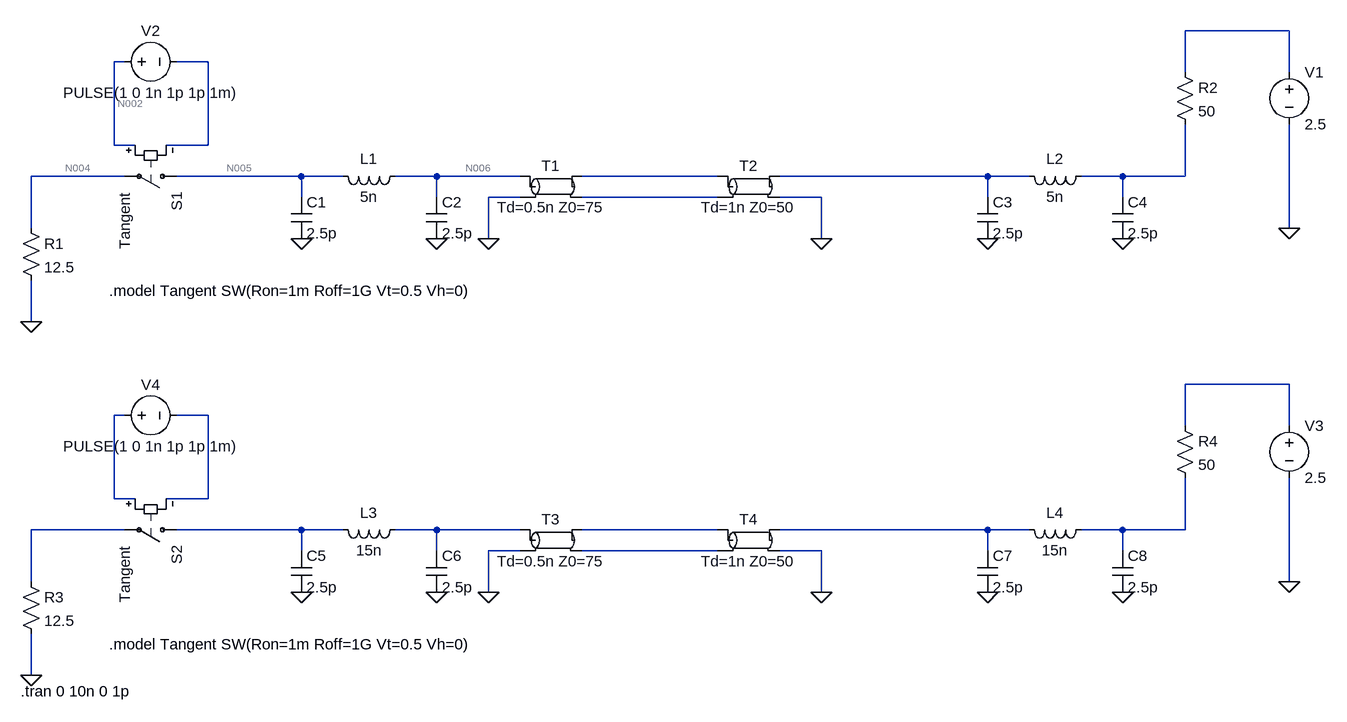
[diagram p0: schematic Exercise8_part4.asc]
Exercise8_part4.asc, the LTspice schematic file:
Version 4.1
SHEET 1 1648 1032
WIRE 1584 0 1424 0
WIRE -208 48 -224 48
WIRE -80 48 -128 48
WIRE 1424 64 1424 0
WIRE 1584 64 1584 0
WIRE -224 176 -224 48
WIRE -192 176 -224 176
WIRE -80 176 -80 48
WIRE -80 176 -144 176
WIRE -208 224 -352 224
WIRE 64 224 -128 224
WIRE 128 224 64 224
WIRE 272 224 208 224
WIRE 400 224 272 224
WIRE 704 224 496 224
WIRE 1120 224 800 224
WIRE 1184 224 1120 224
WIRE 1328 224 1264 224
WIRE 1424 224 1424 144
WIRE 1424 224 1328 224
WIRE 64 256 64 224
WIRE 272 256 272 224
WIRE 400 256 352 256
WIRE 704 256 496 256
WIRE 864 256 800 256
WIRE 1120 256 1120 224
WIRE 1328 256 1328 224
WIRE -352 304 -352 224
WIRE 1584 304 1584 144
WIRE 352 320 352 256
WIRE 864 320 864 256
WIRE -352 448 -352 384
WIRE 1584 544 1424 544
WIRE -208 592 -224 592
WIRE -80 592 -128 592
WIRE 1424 608 1424 544
WIRE 1584 608 1584 544
WIRE -224 720 -224 592
WIRE -192 720 -224 720
WIRE -80 720 -80 592
WIRE -80 720 -144 720
WIRE -208 768 -352 768
WIRE 64 768 -128 768
WIRE 128 768 64 768
WIRE 272 768 208 768
WIRE 400 768 272 768
WIRE 704 768 496 768
WIRE 1120 768 800 768
WIRE 1184 768 1120 768
WIRE 1328 768 1264 768
WIRE 1424 768 1424 688
WIRE 1424 768 1328 768
WIRE 64 800 64 768
WIRE 272 800 272 768
WIRE 400 800 352 800
WIRE 704 800 496 800
WIRE 864 800 800 800
WIRE 1120 800 1120 768
WIRE 1328 800 1328 768
WIRE -352 848 -352 768
WIRE 1584 848 1584 688
WIRE 352 864 352 800
WIRE 864 864 864 800
WIRE -352 992 -352 928
FLAG -352 448 0
FLAG 352 320 0
FLAG 864 320 0
FLAG 1584 304 0
FLAG 272 320 0
FLAG 64 320 0
FLAG 1328 320 0
FLAG 1120 320 0
FLAG -352 992 0
FLAG 352 864 0
FLAG 864 864 0
FLAG 1584 848 0
FLAG 272 864 0
FLAG 64 864 0
FLAG 1328 864 0
FLAG 1120 864 0
SYMBOL res -368 288 R0
SYMATTR InstName R1
SYMATTR Value 12.5
SYMBOL sw -112 224 R90
SYMATTR InstName S1
SYMATTR Value Tangent
SYMBOL tline 448 240 R0
SYMATTR InstName T1
SYMATTR Value Td=0.5n Z0=75
SYMBOL tline 752 240 R0
SYMATTR InstName T2
SYMATTR Value Td=1n Z0=50
SYMBOL res 1408 48 R0
SYMATTR InstName R2
SYMATTR Value 50
SYMBOL voltage 1584 48 R0
WINDOW 123 0 0 Left 0
WINDOW 39 0 0 Left 0
SYMATTR InstName V1
SYMATTR Value 2.5
SYMBOL voltage -224 48 R270
WINDOW 0 32 56 VTop 2
WINDOW 3 -32 56 VBottom 2
WINDOW 123 0 0 Left 0
WINDOW 39 0 0 Left 0
SYMATTR InstName V2
SYMATTR Value PULSE(1 0 1n 1p 1p 1m)
SYMBOL cap 48 256 R0
SYMATTR InstName C1
SYMATTR Value 2.5p
SYMBOL cap 256 256 R0
SYMATTR InstName C2
SYMATTR Value 2.5p
SYMBOL ind 224 208 R90
WINDOW 0 5 56 VBottom 2
WINDOW 3 32 56 VTop 2
SYMATTR InstName L1
SYMATTR Value 5n
SYMATTR SpiceLine Rser=1m
SYMBOL cap 1104 256 R0
SYMATTR InstName C3
SYMATTR Value 2.5p
SYMBOL cap 1312 256 R0
SYMATTR InstName C4
SYMATTR Value 2.5p
SYMBOL ind 1280 208 R90
WINDOW 0 5 56 VBottom 2
WINDOW 3 32 56 VTop 2
SYMATTR InstName L2
SYMATTR Value 5n
SYMATTR SpiceLine Rser=1m
SYMBOL res -368 832 R0
SYMATTR InstName R3
SYMATTR Value 12.5
SYMBOL sw -112 768 R90
SYMATTR InstName S2
SYMATTR Value Tangent
SYMBOL tline 448 784 R0
SYMATTR InstName T3
SYMATTR Value Td=0.5n Z0=75
SYMBOL tline 752 784 R0
SYMATTR InstName T4
SYMATTR Value Td=1n Z0=50
SYMBOL res 1408 592 R0
SYMATTR InstName R4
SYMATTR Value 50
SYMBOL voltage 1584 592 R0
WINDOW 123 0 0 Left 0
WINDOW 39 0 0 Left 0
SYMATTR InstName V3
SYMATTR Value 2.5
SYMBOL voltage -224 592 R270
WINDOW 0 32 56 VTop 2
WINDOW 3 -32 56 VBottom 2
WINDOW 123 0 0 Left 0
WINDOW 39 0 0 Left 0
SYMATTR InstName V4
SYMATTR Value PULSE(1 0 1n 1p 1p 1m)
SYMBOL cap 48 800 R0
SYMATTR InstName C5
SYMATTR Value 2.5p
SYMBOL cap 256 800 R0
SYMATTR InstName C6
SYMATTR Value 2.5p
SYMBOL ind 224 752 R90
WINDOW 0 5 56 VBottom 2
WINDOW 3 32 56 VTop 2
SYMATTR InstName L3
SYMATTR Value 15n
SYMATTR SpiceLine Rser=1m
SYMBOL cap 1104 800 R0
SYMATTR InstName C7
SYMATTR Value 2.5p
SYMBOL cap 1312 800 R0
SYMATTR InstName C8
SYMATTR Value 2.5p
SYMBOL ind 1280 752 R90
WINDOW 0 5 56 VBottom 2
WINDOW 3 32 56 VTop 2
SYMATTR InstName L4
SYMATTR Value 15n
SYMATTR SpiceLine Rser=1m
TEXT -232 400 Left 2 !.model Tangent SW(Ron=1m Roff=1G Vt=0.5 Vh=0)
TEXT -232 944 Left 2 !.model Tangent SW(Ron=1m Roff=1G Vt=0.5 Vh=0)
TEXT -368 1016 Left 2 !.tran 0 10n 0 1p

The netlist it stands for:
* Exercise8_part4.asc
R1 N004 0 12.5
S1 N005 N004 N002 N003 Tangent
T1 N006 0 N007 N010 Td=0.5n Z0=75
T2 N007 N010 N008 0 Td=1n Z0=50
R2 N001 N009 50
V1 N001 0 2.5
V2 N002 N003 PULSE(1 0 1n 1p 1p 1m)
C1 N005 0 2.5p
C2 N006 0 2.5p
L1 N006 N005 5n Rser=1m
C3 N008 0 2.5p
C4 N009 0 2.5p
L2 N009 N008 5n Rser=1m
R3 N014 0 12.5
S2 N015 N014 N012 N013 Tangent
T3 N016 0 N017 N020 Td=0.5n Z0=75
T4 N017 N020 N018 0 Td=1n Z0=50
R4 N011 N019 50
V3 N011 0 2.5
V4 N012 N013 PULSE(1 0 1n 1p 1p 1m)
C5 N015 0 2.5p
C6 N016 0 2.5p
L3 N016 N015 15n Rser=1m
C7 N018 0 2.5p
C8 N019 0 2.5p
L4 N019 N018 15n Rser=1m
.model Tangent SW(Ron=1m Roff=1G Vt=0.5 Vh=0)
.model Tangent SW(Ron=1m Roff=1G Vt=0.5 Vh=0)
.tran 0 10n 0 1p
.backanno
.end

* Results of the author's LTspice run, read from the files saved beside the schematic
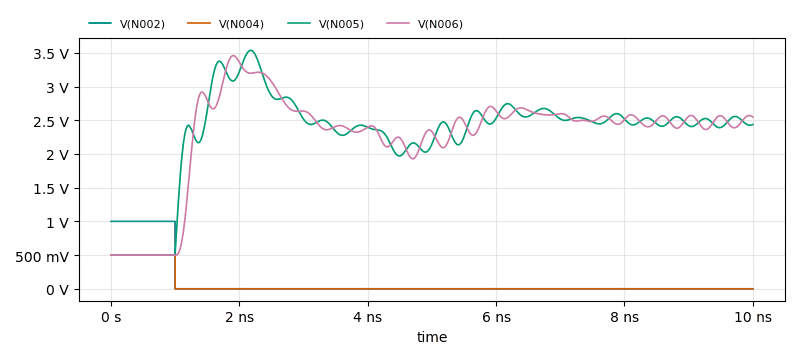
[diagram p1: Transient Analysis of Exercise8_part4.asc, plotted from the saved traces]
* Transient Analysis, 1 run:
*   V(N002): min 0 V, max 1 V, average 100 mV, rms 316.3 mV, last 0 V
*   V(N004): min 0 V, max 500 mV, average 50.02 mV, rms 158.1 mV, last 0 V
*   V(N005): min 500 mV, max 3.536 V, average 2.322 V, rms 2.421 V, last 2.438 V
*   V(N006): min 500.1 mV, max 3.459 V, average 2.302 V, rms 2.408 V, last 2.547 V